# EasyEDA Pro project ProPrj_omb-2024-nano_2026-02-09.epro, schematic Schematic1
Create Date: 2024-05-23; Page Name: P1; Project Name: omb-2024-nano; Schematic Name: Schematic1; Update Date: 2024-05-23; Company: EasyEDA.com; Drawn: EasyEDA; Page Size: A4; Part Number: JLCPCB-002; Reviewed: EasyEDA; Version: V0.1
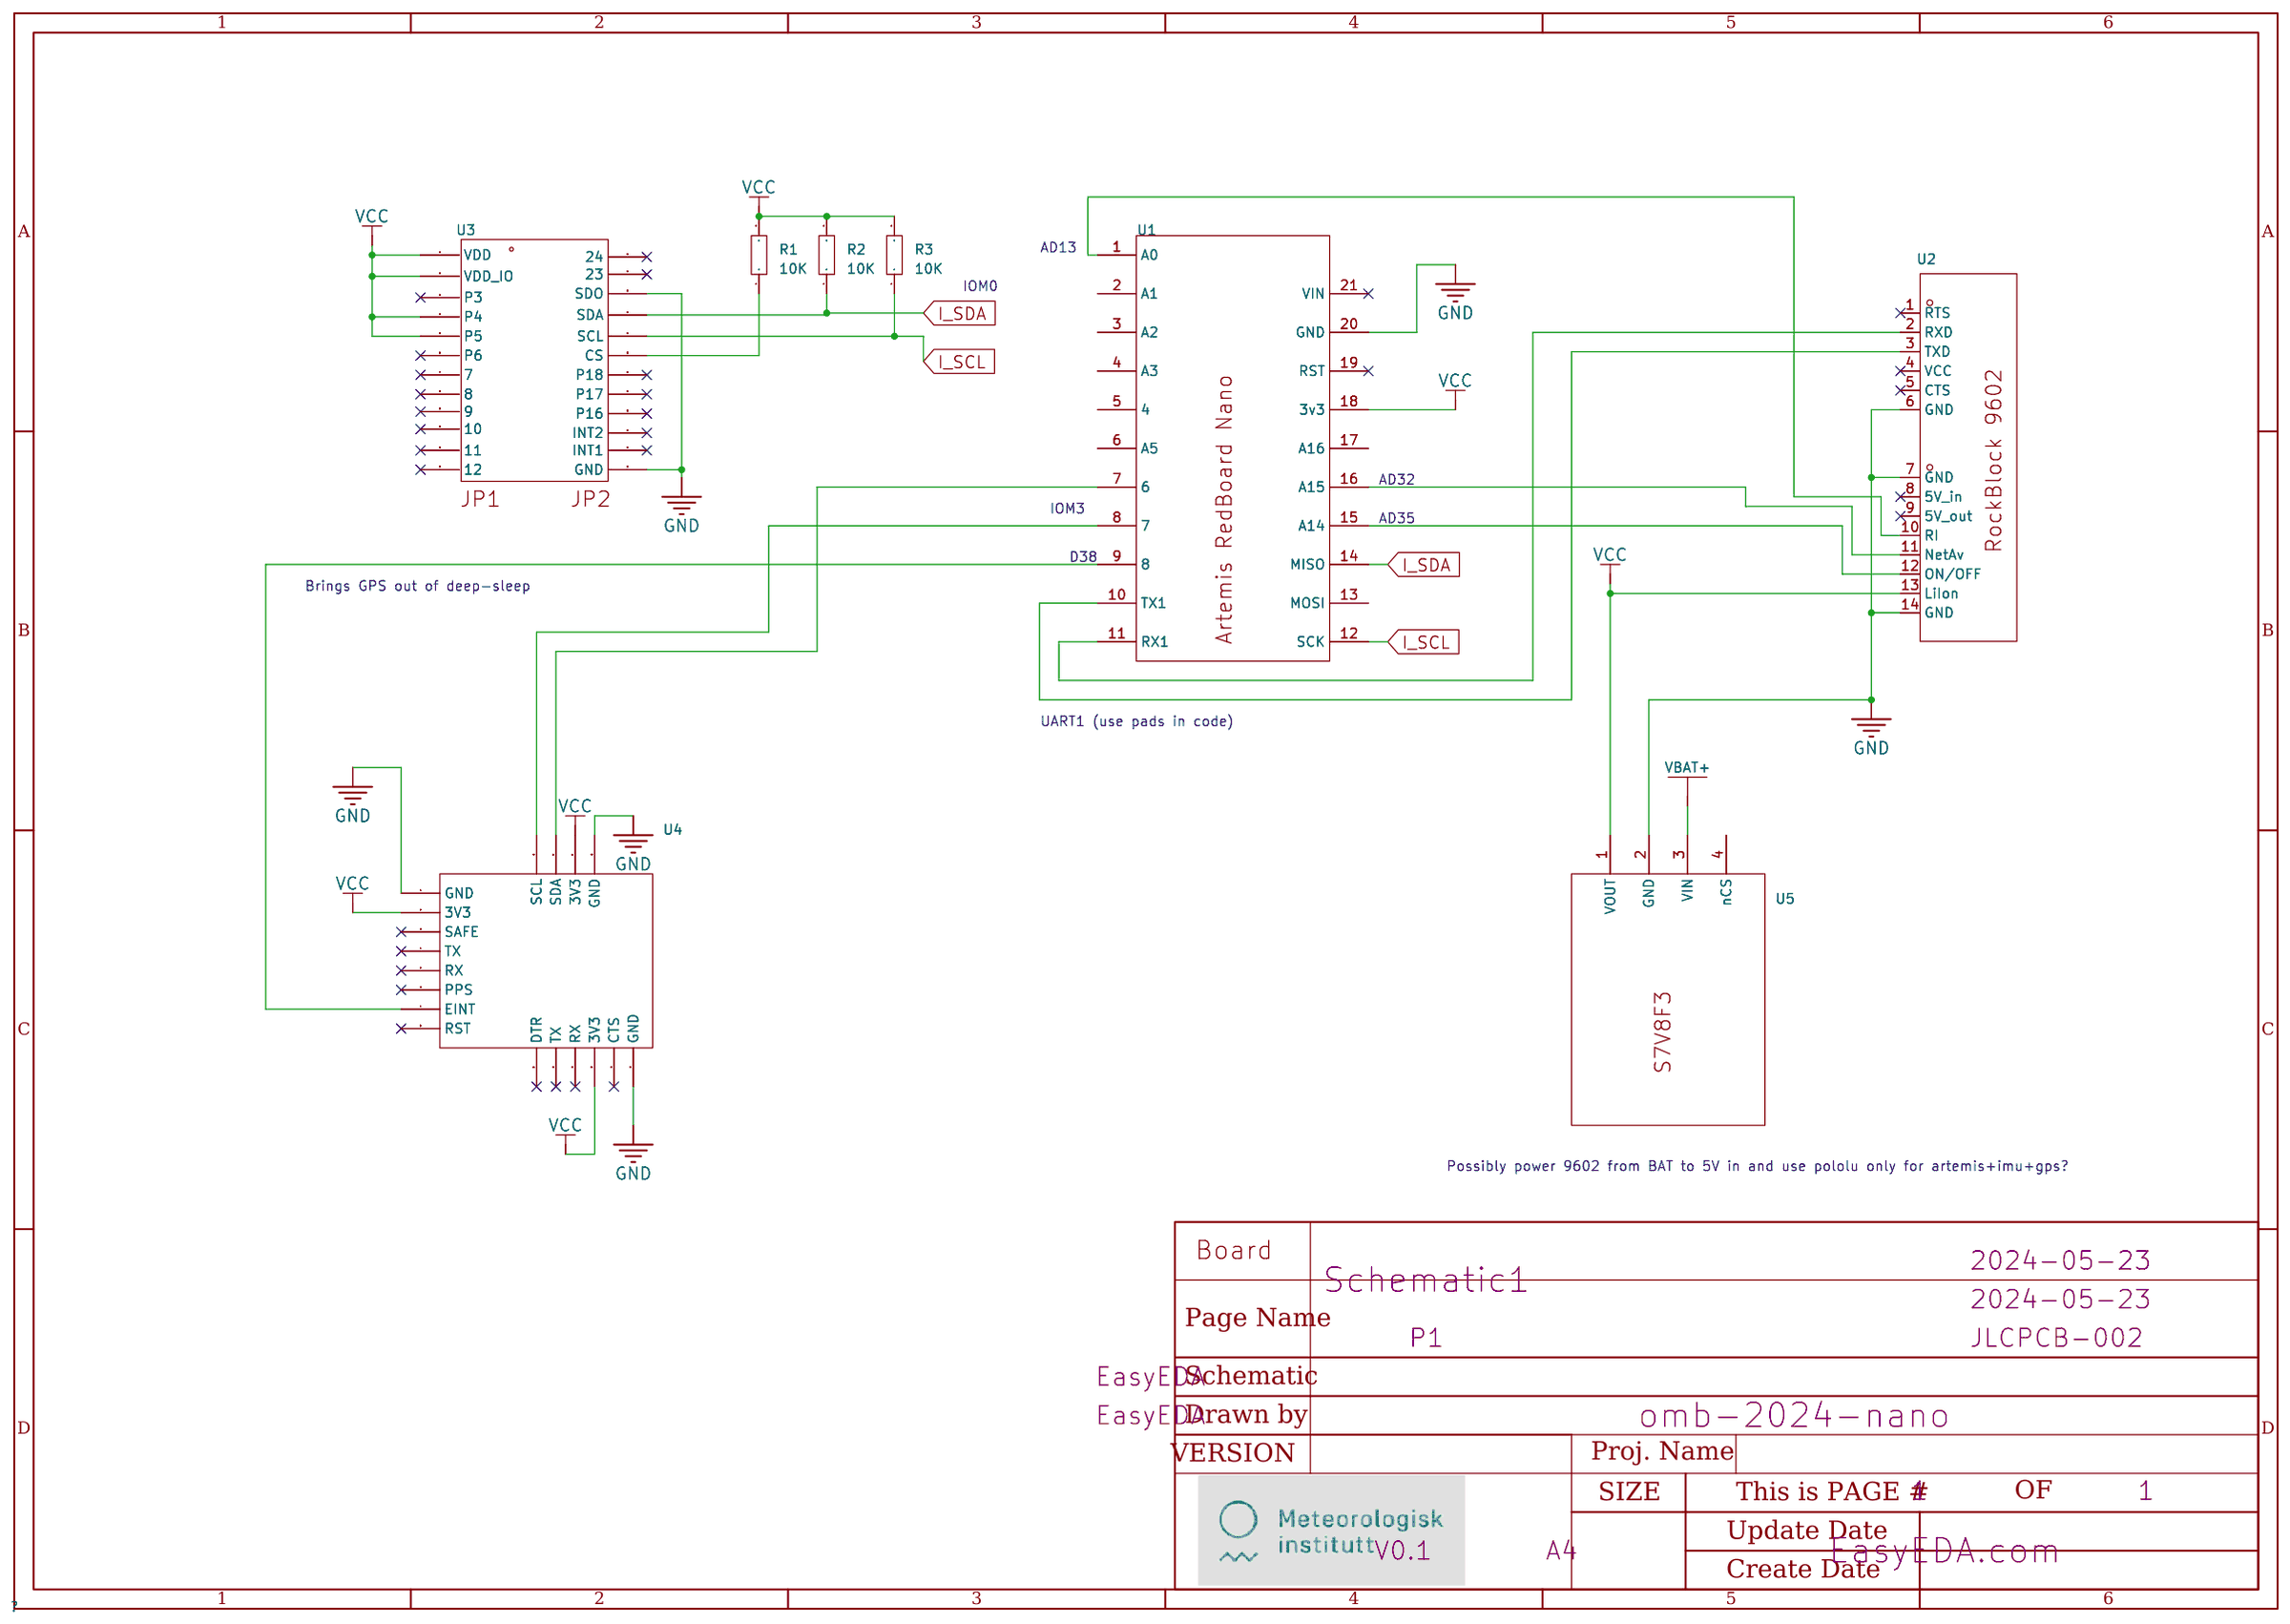
[diagram p0: schematic sheet]

## Parts
R1  10K  [R0603]
R2  10K  [R0603]
R3  10K  [R0603]
U1  -  [ARTEMIS REDBOARD NANO]
U2  -  [HDR-F-2.54_1X15]
U3  -  [STEVAL-MKI159V1]
U4  -  [SPARKFUN_U-BLOX_MAX-M10S]
U5  -  [S7V8F3]

## Library data of the parts
R1-R3 = Res_0603: Supplier Footprint: 0603
U1 = Artemis RedBoard Nano
U2 = Rockblock9602
U3 = STEVAL-MKI205V1
U4 = sparkfun_u-blox_MAX-M10S
U5 = S7V8F3

## Nets
GND: U1.20(GND) U2.6(GND) U2.7(GND) U2.14(GND) U3.13(GND) U3.22(SDO) U4.1(GND) U4.14(GND) U4.18(GND) U5.2(GND)
VBAT+: U5.3(VIN)
VCC: R1.2 R2.2 R3.2 U1.18(3v3) U2.13(LiIon) U3.1(VDD) U3.2(VDD_IO) U3.4(P4) U3.5(P5) U4.2(3V3) U4.12(3V3) U4.17(3V3) U5.1(VOUT)
I_SCL: R3.1 U1.12(SCK) U3.20(SCL)
I_SDA: R2.1 U1.14(MISO) U3.21(SDA)
$1N994: R1.1 U3.19(CS)
$1N1205: U1.15(A14) U2.12(ON/OFF)
$1N1212: U1.11(RX1) U2.2(RXD)
$1N1219: U1.10(TX1) U2.3(TXD)
$1N1325: U1.9(8) U4.7(EINT)
$1N1474: U1.7(6) U4.16(SDA)
$1N1527: U1.8(7) U4.15(SCL)
$1N1582: U1.16(A15) U2.11(NetAv)
Net-(U1-1): U1.1(A0) U2.10(RI)

Not connected (* = marked no-connect by the designer): U1 2(A1) 3(A2) 4(A3) 5(4) 6(A5) 13(MOSI) 17(A16) 19(RST)* 21(VIN)*; U2 1(RTS)* 4(VCC)* 5(CTS)* 8(5V in)* 9(5V out)*; U3 3(P3)* 6(P6)* 7* 8* 9* 10* 11* 12* 14(INT1)* 15(INT2)* 16(P16)* 17(P17)* 18(P18)* 23* 24*; U4 3(SAFE)* 4(TX)* 5(RX)* 6(PPS)* 8(RST)* 9(DTR)* 10(TX)* 11(RX)* 13(CTS)*; U5 4(nCS)

## Notes on the sheet
- AD13
- IOM0
- AD32
- IOM3
- AD35
- D38
- Brings GPS out of deep-sleep
- UART1 (use pads in code)
- Possibly power 9602 from BAT to 5V in and use pololu only for artemis+imu+gps?
